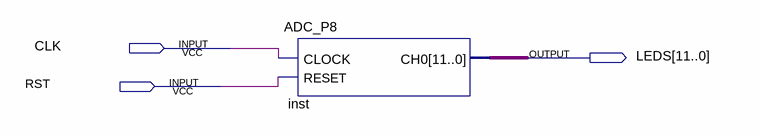
[diagram p0: schematic sheet]
// Quartus schematic pr.bdf as structural Verilog: 1 symbols, 3 pins
module pr (
  input  CLK,
  input  RST,
  output [11:0] LEDS
);

  ADC_P8 inst (.CLOCK(CLK), .RESET(RST), .CH0(LEDS));
endmodule
